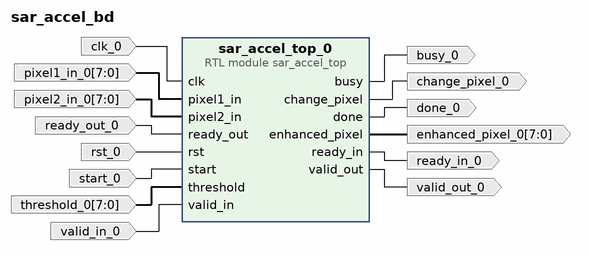
[diagram p0: block diagram of the top level]
# Vivado block design sar_accel_bd, xc7a35tcpg236-1, Vivado 2026.1
create_bd_design sar_accel_bd

create_bd_port -dir I -type clk clk_0
create_bd_port -dir I -type rst rst_0
create_bd_port -dir I start_0
create_bd_port -dir I valid_in_0
create_bd_port -dir I -from 7 -to 0 pixel1_in_0
create_bd_port -dir I -from 7 -to 0 pixel2_in_0
create_bd_port -dir I -from 7 -to 0 threshold_0
create_bd_port -dir I ready_out_0
create_bd_port -dir O ready_in_0
create_bd_port -dir O busy_0
create_bd_port -dir O done_0
create_bd_port -dir O valid_out_0
create_bd_port -dir O -from 7 -to 0 enhanced_pixel_0
create_bd_port -dir O change_pixel_0

create_bd_cell -type module -reference sar_accel_top sar_accel_top_0

# ---- connections ----

connect_bd_net -net clk_0_1 [get_bd_ports clk_0] [get_bd_pins sar_accel_top_0/clk]
connect_bd_net -net pixel1_in_0_1 [get_bd_ports pixel1_in_0] [get_bd_pins sar_accel_top_0/pixel1_in]
connect_bd_net -net pixel2_in_0_1 [get_bd_ports pixel2_in_0] [get_bd_pins sar_accel_top_0/pixel2_in]
connect_bd_net -net ready_out_0_1 [get_bd_ports ready_out_0] [get_bd_pins sar_accel_top_0/ready_out]
connect_bd_net -net rst_0_1 [get_bd_ports rst_0] [get_bd_pins sar_accel_top_0/rst]
connect_bd_net [get_bd_pins sar_accel_top_0/busy] [get_bd_ports busy_0]
connect_bd_net [get_bd_pins sar_accel_top_0/change_pixel] [get_bd_ports change_pixel_0]
connect_bd_net [get_bd_pins sar_accel_top_0/done] [get_bd_ports done_0]
connect_bd_net [get_bd_pins sar_accel_top_0/enhanced_pixel] [get_bd_ports enhanced_pixel_0]
connect_bd_net [get_bd_pins sar_accel_top_0/ready_in] [get_bd_ports ready_in_0]
connect_bd_net [get_bd_pins sar_accel_top_0/valid_out] [get_bd_ports valid_out_0]
connect_bd_net -net start_0_1 [get_bd_ports start_0] [get_bd_pins sar_accel_top_0/start]
connect_bd_net -net threshold_0_1 [get_bd_ports threshold_0] [get_bd_pins sar_accel_top_0/threshold]
connect_bd_net -net valid_in_0_1 [get_bd_ports valid_in_0] [get_bd_pins sar_accel_top_0/valid_in]

validate_bd_design
save_bd_design
